# Altium schematic sheet SmartCitiesSchDoc.SchDoc
size A4; SheetNumber: 1; SheetTotal: 1
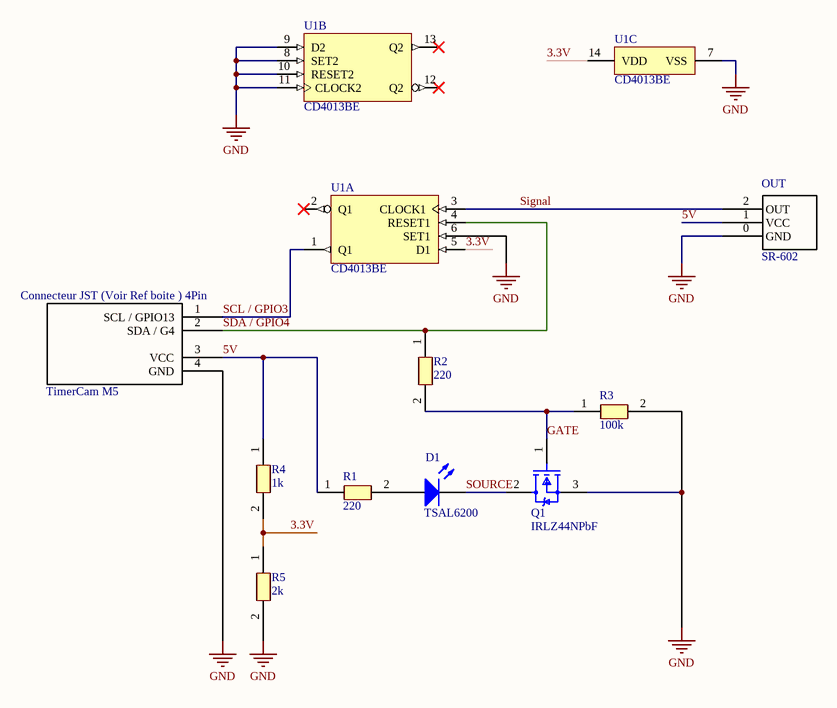
[diagram p0: SmartCitiesSchDoc.SchDoc]

## Parts
D1  TSAL6200  [LED INF]
OUT  SR-602  [SR602]
Q1  IRLZ44NPbF  [IRF44Nfb]
R1  220  [RESISTOR_0805]
R2  220  [RESISTOR_0805]
R3  100k  [RESISTOR_0805]
R4  1k  [RESISTOR_0805]
R5  2k  [RESISTOR_0805]
TimerCam_M5  TimerCam M5  [TimerCam5]
U1  CD4013BE  [N0014A]  (parts A,B,C of 3)

## Nets
GND: OUT.0(GND) Q1.3(S) R3.2 R5.2 TimerCam_M5.4(GND) U1.6(SET1) U1.7(VSS) U1.8(SET2) U1.9(D2) U1.10(RESET2) U1.11(CLOCK2)
3.3V: R4.2 R5.1 U1.5(D1) U1.14(VDD)
5V: OUT.1(VCC) R1.1 R4.1 TimerCam_M5.3(VCC)
GATE: Q1.1(G) R2.2 R3.1
SCL / GPIO3: TimerCam_M5.1(SCL_/_GPIO13) U1.1(Q1)
SDA / GPIO4: R2.1 TimerCam_M5.2(SDA_/_G4) U1.4(RESET1)
Signal: OUT.2(OUT) U1.3(CLOCK1)
SOURCE: D1.2(K) Q1.2(D)
NetD1_1: D1.1(A) R1.2

Not connected (* = marked no-connect by the designer): U1 2(Q1)* 12(Q2)* 13(Q2)*

## Notes on the sheet
- (near TimerCam_M5) Connecteur JST (Voir Ref boite ) 4Pin

## Library data of the parts
D1 = LED INF: High Power Infrared Emitting Diode, GaAlAs, MQW, 1.35 V, 100 mA, -40 to 85 degC, 2-Pin THD, RoHS, Bulk; Manufacturer: Vishay; Lum Intensity: 500mW/srmcd; Product Depth (mm): 5.8mm; Type: IrLED; Luminous Intensity: 500mW/sr; Forward Voltage: 3V; Shape Type: Circular; Peak Wavelength: 950nm; Rad Hardened: No; Product Height (mm): 8.7mm; Number of  Elements: 1; Forward Current: 100mA; High Brightness: Yes; Reverse Voltage: 5V; DELETED: Compliant; Power Dissipation: 160W; Viewing Angle: 34deg; Lens Type: Colored; Packaging: Bulk; Lens Dimensions: 5x5x7.7mm; Package Reference: TSAL6200; Chip Material: GaAlAs; Package Description: 2-Pin Through Hole Device, Dia 5.8 mm, Pitch 2.54 mm; Main Category: IrLED; Manufacturer URL: http://www.vishay.com/; Product Length (mm): 5.8mm; Datasheet URL: http://www.vishay.com/docs/81010/tsal6200.pdf; Operating Temperature Classification: Industrial; Package Type: T-13/4; Pin Count: 2; Mounting: ThroughHole; Mounting Technology: ThroughHole; Test Current (It): 100mA; Datasheet Version: Rev. 2.4, 03/2014; Operating Temp Range: -40Cto85C
OUT = SR-602: PIR module
Q1 = IRLZ44NPbF: MOSFET N-CH 55V 47A TO220AB; Turn-On Delay Time: 11ns; Gate to Source Voltage (Vgs): 16V; Element Configuration: Single; Rds On Max: 22mR; Turn-Off Delay Time: 26ns; Max Power Dissipation: 110W; Threshold Voltage: 2V; Drain to Source Resistance: 35mR; Input Capacitance: 1.7nF; Continuous Drain Current (ID): 47A; Case/Package: TO-220; Lead Free: Lead Free; Halogen Free: Halogen Free; Packaging: Rail/Tube; Length: 0.414inch; Min Operating Temperature: -55°C; REACH SVHC: No SVHC; Number of Pins: 3; Width: 0.185inch; Drain to Source Voltage (Vdss): 55V; Power Dissipation: 110W; RoHS Compliant: Yes; Max Operating Temperature: 175°C; Height: 0.6inch; Max Dual Supply Voltage: 55V; Drain to Source Breakdown Voltage: 55V; Mount: Through Hole
R1-R5 = Resistor: Résistance
U1 = CMP-1619-00744-2: CMOS Dual D-Type Flip Flop, N0014A, TUBE; Manufacturer: Texas Instruments; Schmitt Trigger: No; F @ Nom Voltage(Max)(Mhz): 8; tpd @ Nom Voltage(Max)(ns): 130; Output Logic: Inverted,Non-inverted; Rating: Military; Technology Family: CD4000; Voltage(Nom)(V): 10; Bits(#): 2; Output Drive (IOL/IOH)(Max)(mA): 1.5/-1.5; VCC(Min)(V): 3; VCC(Max)(V): 18; ICC @ Nom Voltage(Max)(mA): 0.06; Generic Part Number: CD4013B; 3-State Output: No; DatasheetVersion: SCHS023D; Input Type: CMOS; Code_JEDEC: MS-001; Operating Temperature Range(C): -55 to 125; PackageReference: N0014A; Output Type: CMOS